# Altium schematic sheet Symbols.SchDoc
size A4
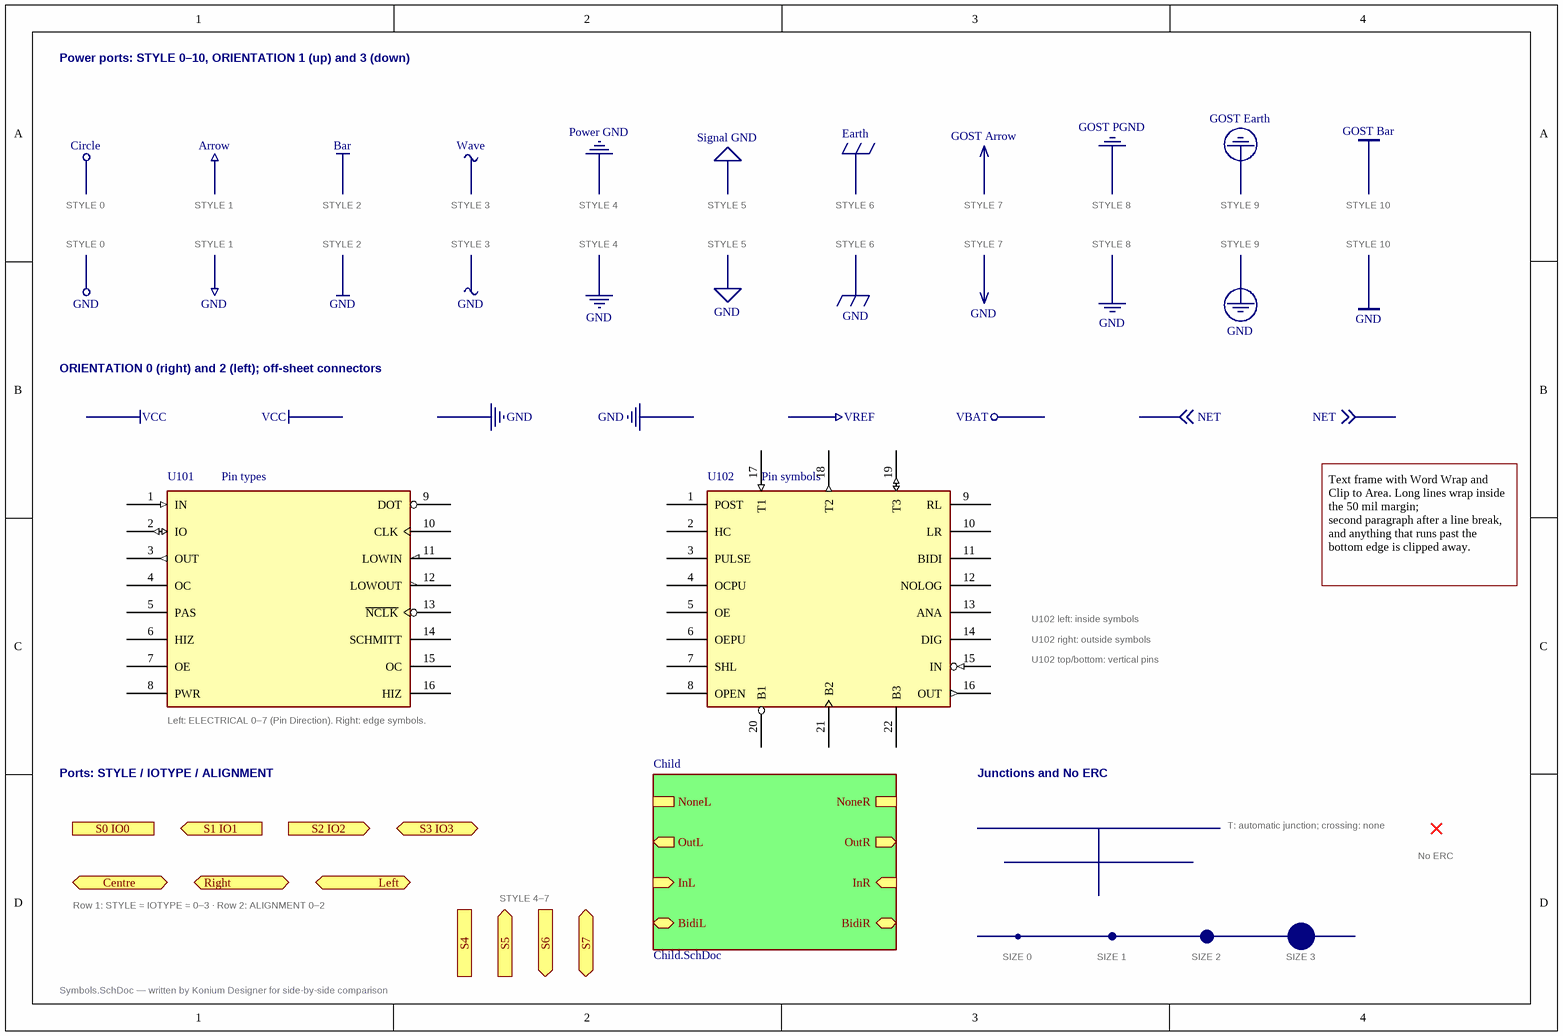
[diagram p0: Symbols.SchDoc]

## Parts
U101  Pin types  (graphical)
U102  Pin symbols  (graphical)

## Sub-sheets
Child = Child.SchDoc: NoneL, NoneR, OutL (out), OutR (out), InL (in), InR (in), BidiL (bidir), BidiR (bidir)

## Ports
Centre (bidir), Left (bidir), Right (bidir), S0 IO0, S1 IO1 (out), S2 IO2 (in), S3 IO3 (bidir), S4, S5, S6, S7

## Nets

Not connected (* = marked no-connect by the designer): U101 1(IN) 2(IO) 3(OUT) 4(OC) 5(PAS) 6(HIZ) 7(OE) 8(PWR) 9(DOT) 10(CLK) 11(LOWIN) 12(LOWOUT) 13(~{NCLK}) 14(SCHMITT) 15(OC) 16(HIZ); U102 1(POST) 2(HC) 3(PULSE) 4(OCPU) 5(OE) 6(OEPU) 7(SHL) 8(OPEN) 9(RL) 10(LR) 11(BIDI) 12(NOLOG) 13(ANA) 14(DIG) 15(IN) 16(OUT) 17(T1) 18(T2) 19(T3) 20(B1) 21(B2) 22(B3)

## Notes on the sheet
- Power ports: STYLE 0–10, ORIENTATION 1 (up) and 3 (down)
- STYLE 0
- STYLE 1
- STYLE 2
- STYLE 3
- STYLE 4
- STYLE 5
- STYLE 6
- STYLE 7
- STYLE 8
- STYLE 9
- STYLE 10
- ORIENTATION 0 (right) and 2 (left); off-sheet connectors
- Text frame with Word Wrap and Clip to Area. Long lines wrap inside the 50 mil margin;
  second paragraph after a line break, and anything that runs past the bottom edge is clipped away.
- U102 left: inside symbols
- U102 right: outside symbols
- U102 top/bottom: vertical pins
- Ports: STYLE / IOTYPE / ALIGNMENT
- (near U101) Left: ELECTRICAL 0–7 (Pin Direction). Right: edge symbols.
- Junctions and No ERC
- T: automatic junction; crossing: none
- No ERC
- Row 1: STYLE = IOTYPE = 0–3 · Row 2: ALIGNMENT 0–2
- STYLE 4–7
- SIZE 0
- SIZE 1
- SIZE 2
- SIZE 3
- Symbols.SchDoc — written by Konium Designer for side-by-side comparison